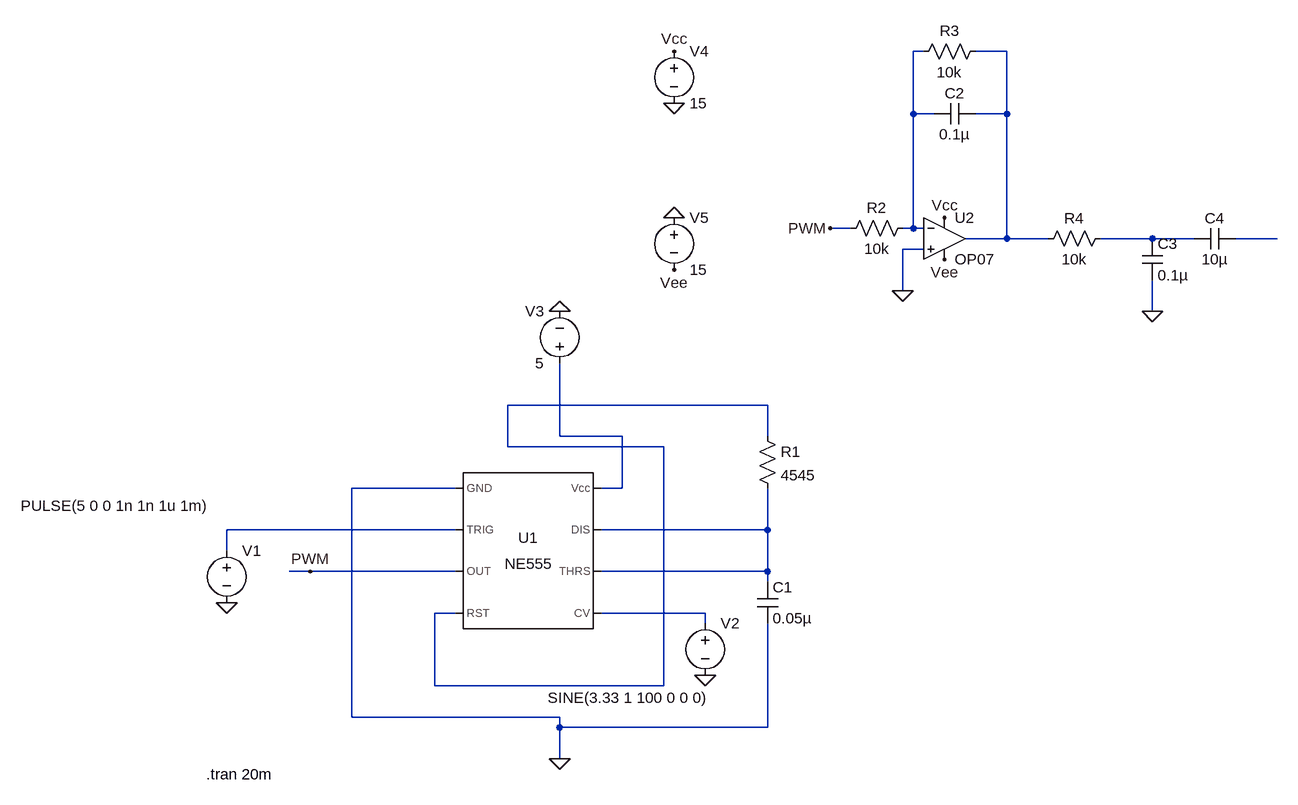
[diagram p0: schematic Pulse width modulation and demodulation.asc]
Pulse width modulation and demodulation.asc, the LTspice schematic file:
Version 4
SHEET 1 1364 680
WIRE 816 -608 800 -608
WIRE 944 -608 896 -608
WIRE 800 -512 800 -608
WIRE 832 -512 800 -512
WIRE 944 -512 944 -608
WIRE 944 -512 896 -512
WIRE 704 -336 672 -336
WIRE 800 -336 800 -512
WIRE 800 -336 784 -336
WIRE 816 -336 800 -336
WIRE 944 -320 944 -512
WIRE 944 -320 880 -320
WIRE 1008 -320 944 -320
WIRE 1168 -320 1088 -320
WIRE 1232 -320 1168 -320
WIRE 1360 -320 1296 -320
WIRE 816 -304 784 -304
WIRE 784 -240 784 -304
WIRE 1168 -208 1168 -256
WIRE 576 -64 176 -64
WIRE 256 -16 256 -128
WIRE 352 -16 256 -16
WIRE 576 -16 576 -64
WIRE 176 0 176 -64
WIRE 416 0 176 0
WIRE 96 64 -64 64
WIRE 352 64 352 -16
WIRE 352 64 320 64
WIRE 96 128 -256 128
WIRE 576 128 576 64
WIRE 576 128 320 128
WIRE -256 160 -256 128
WIRE -128 192 -160 192
WIRE 96 192 -128 192
WIRE 576 192 576 128
WIRE 576 192 320 192
WIRE 576 208 576 192
WIRE 96 256 64 256
WIRE 480 256 320 256
WIRE 480 272 480 256
WIRE 64 368 64 256
WIRE 416 368 416 0
WIRE 416 368 64 368
WIRE -64 416 -64 64
WIRE 256 416 -64 416
WIRE 256 432 256 416
WIRE 576 432 576 272
WIRE 576 432 256 432
WIRE 256 480 256 432
FLAG 256 480 0
FLAG -256 240 0
FLAG 256 -208 0
FLAG 480 352 0
FLAG -128 192 PWM
FLAG 672 -336 PWM
FLAG 784 -240 0
FLAG 1168 -208 0
FLAG 432 -608 Vcc
FLAG 432 -528 0
FLAG 432 -272 Vee
FLAG 432 -352 0
FLAG 848 -352 Vcc
FLAG 848 -288 Vee
SYMBOL Misc\\NE555 208 160 R0
SYMATTR InstName U1
SYMBOL res 560 -32 R0
SYMATTR InstName R1
SYMATTR Value 4545
SYMBOL cap 560 208 R0
SYMATTR InstName C1
SYMATTR Value 0.05µ
SYMBOL voltage -256 144 R0
WINDOW 123 0 0 Left 0
WINDOW 39 0 0 Left 0
WINDOW 3 -317 -53 Left 2
SYMATTR InstName V1
SYMATTR Value PULSE(5 0 0 1n 1n 1u 1m)
SYMBOL voltage 480 256 R0
WINDOW 123 0 0 Left 0
WINDOW 39 0 0 Left 0
WINDOW 3 -242 130 Left 2
SYMATTR InstName V2
SYMATTR Value SINE(3.33 1 100 0 0 0)
SYMBOL voltage 256 -112 R180
WINDOW 0 24 96 Left 2
WINDOW 3 24 16 Left 2
WINDOW 123 0 0 Left 0
WINDOW 39 0 0 Left 0
SYMATTR InstName V3
SYMATTR Value 5
SYMBOL OpAmps\\OP07 848 -384 R0
SYMATTR InstName U2
SYMBOL res 800 -352 R90
WINDOW 0 0 56 VBottom 2
WINDOW 3 32 56 VTop 2
SYMATTR InstName R2
SYMATTR Value 10k
SYMBOL res 912 -624 R90
WINDOW 0 0 56 VBottom 2
WINDOW 3 32 56 VTop 2
SYMATTR InstName R3
SYMATTR Value 10k
SYMBOL cap 896 -528 R90
WINDOW 0 0 32 VBottom 2
WINDOW 3 32 32 VTop 2
SYMATTR InstName C2
SYMATTR Value 0.1µ
SYMBOL res 1104 -336 R90
WINDOW 0 0 56 VBottom 2
WINDOW 3 32 56 VTop 2
SYMATTR InstName R4
SYMATTR Value 10k
SYMBOL cap 1152 -320 R0
SYMATTR InstName C3
SYMATTR Value 0.1µ
SYMBOL cap 1296 -336 R90
WINDOW 0 0 32 VBottom 2
WINDOW 3 32 32 VTop 2
SYMATTR InstName C4
SYMATTR Value 10µ
SYMBOL voltage 432 -624 R0
WINDOW 123 0 0 Left 0
WINDOW 39 0 0 Left 0
SYMATTR InstName V4
SYMATTR Value 15
SYMBOL voltage 432 -368 R0
WINDOW 123 0 0 Left 0
WINDOW 39 0 0 Left 0
SYMATTR InstName V5
SYMATTR Value 15
TEXT -288 504 Left 2 !.tran 20m

The netlist it stands for:
* Pulse width modulation and demodulation.asc
XU1 0 N007 PWM N005 N009 N008 N008 N006 NE555  ; pins GND TRIG OUT RST CV THRS DIS Vcc
R1 N005 N008 4545
C1 N008 0 0.05µ
V1 N007 0 PULSE(5 0 0 1n 1n 1u 1m)
V2 N009 0 SINE(3.33 1 100 0 0 0)
V3 N006 0 5
XU2 0 N001 Vcc Vee N002 LT1001  ; OP07, pins In+ In- V+ V- OUT
R2 N001 PWM 10k
R3 N002 N001 10k
C2 N002 N001 0.1µ
R4 N003 N002 10k
C3 N003 0 0.1µ
C4 N004 N003 10µ
V4 Vcc 0 15
V5 0 Vee 15
.tran 20m
.lib NE555.sub
.lib LTC.lib
.backanno
.end